# Altium schematic sheet 08_RJ45.SchDoc
size 322 x 137 mm; DsnPath: C:\Users\nilot\Documents\VSCode\SBC\imports\SG2002_QFN88_38_20230301_4L_V1.3_16.2.DSN; SchematicName: CV181xC_QFN88_38_DemoBoard; PageName: 08_RJ45; PageSize: Custom; TopSchematic: True
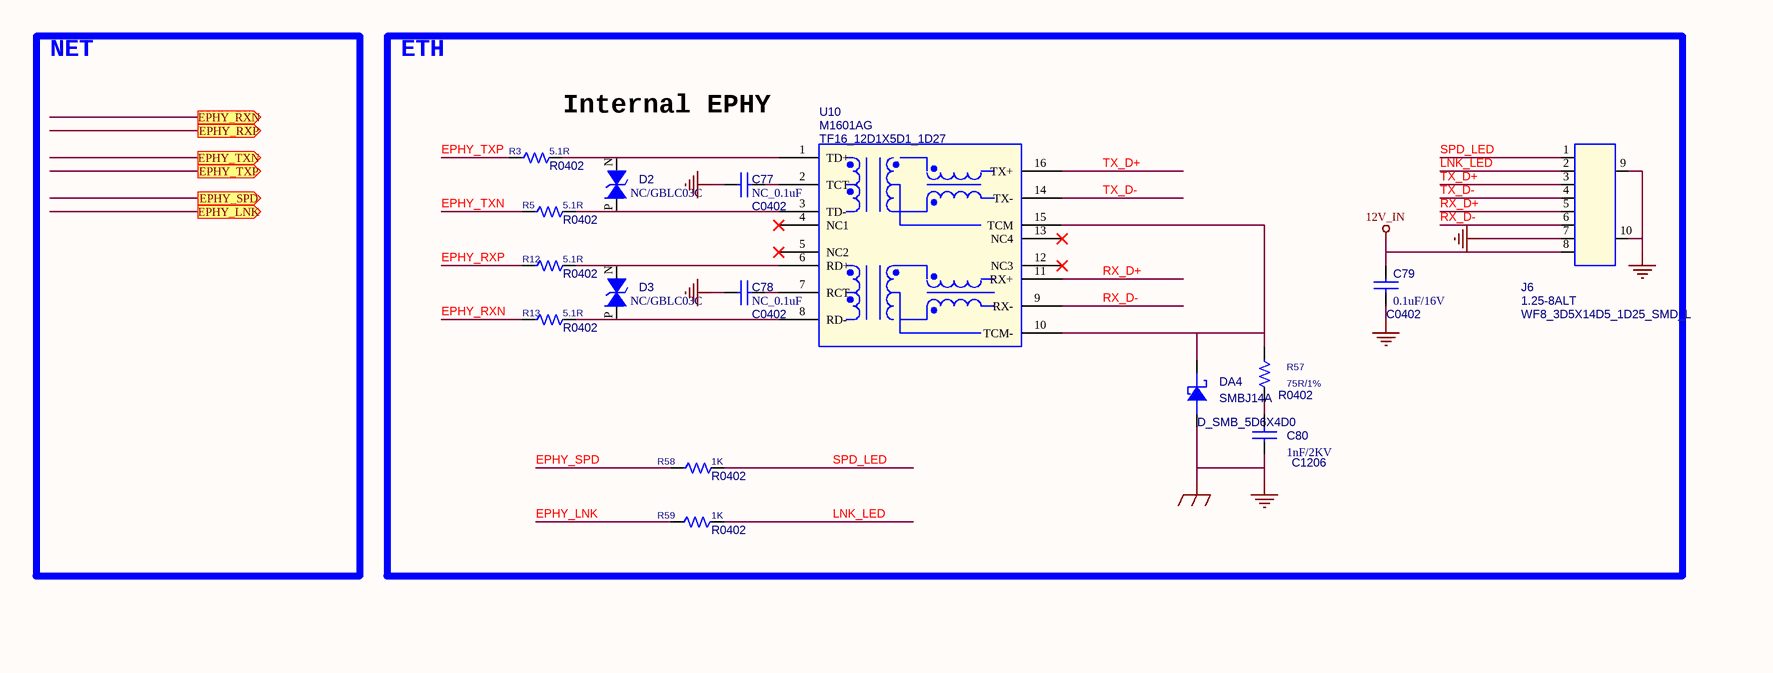
[diagram p0: 08_RJ45.SchDoc, top left]
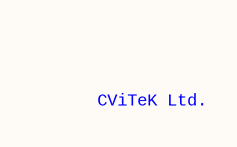
[diagram p1: 08_RJ45.SchDoc, bottom right]

## Parts
C77  NC_0.1uF  [C0402]
C78  NC_0.1uF  [C0402]
C79  0.1uF/16V  [C0402]
C80  1nF/2KV  [C1206]
D2  NC/GBLC03C  [SOD323_1D4X1D8]
D3  NC/GBLC03C  [SOD323_1D4X1D8]
DA4  SMBJ14A  [D_SMB_5D6X4D0]
J6  1.25-8ALT  [WF8_3D5X14D5_1D25_SMD_L]
R3  5.1R  [R0402]
R5  5.1R  [R0402]
R12  5.1R  [R0402]
R13  5.1R  [R0402]
R57  75R/1%  [R0402]
R58  1K  [R0402]
R59  1K  [R0402]
U10  M1601AG  [TF16_12D1X5D1_1D27]

## Ports
EPHY_LNK (out), EPHY_RXN (out), EPHY_RXP (out), EPHY_SPD (out), EPHY_TXN (out), EPHY_TXP (out)

## Nets
12V_IN: C79.1 J6.8
CHASSI_GND: C77.1 C78.1 C79.2 C80.1 DA4.P J6.7 J6.9 J6.10  [also labelled GND]
EPHY_LNK: R59.2
EPHY_RXN: R13.1
EPHY_RXP: R12.1
EPHY_SPD: R58.1
EPHY_TXN: R5.1
EPHY_TXP: R3.1
LNK_LED: J6.2 R59.1
RX_D+: J6.5 U10.11(RX+)
RX_D-: J6.6 U10.9(RX-)
SPD_LED: J6.1 R58.2
TX_D+: J6.3 U10.16(TX+)
TX_D-: J6.4 U10.14(TX-)
NetC77_2: C77.2 U10.2(TCT)
NetC78_2: C78.2 U10.7(RCT)
NetC80_2: C80.2 R57.2
NetD2_N: D2.N R3.2 U10.1(TD+)
NetD2_P: D2.P R5.2 U10.3(TD-)
NetD3_N: D3.N R12.2 U10.6(RD+)
NetD3_P: D3.P R13.2 U10.8(RD-)
NetDA4_N: DA4.N R57.1 U10.10(TCM-) U10.15(TCM)

Not connected (* = marked no-connect by the designer): U10 4(NC1)* 5(NC2)* 12(NC3)* 13(NC4)*

## Notes on the sheet
- NET
- ETH
- Internal EPHY
- CViTeK Ltd.

## Library data of the parts
C77 = C: ÌùÆ¬µçÈÝ CAP CER 0.1UF 16V 10% X7R 0402; Part Name: sC0402; Part Reference: C77; Cloud IC Number: Y02110431K00; Vendor: murata; Value: NC_0.1uF; PCB Footprint: C0402
C78 = C: ÌùÆ¬µçÈÝ CAP CER 0.1UF 16V 10% X7R 0402; Part Name: sC0402; Part Reference: C78; Cloud IC Number: Y02110431K00; Vendor: murata; Value: NC_0.1uF; PCB Footprint: C0402
C79 = C: C0402; Part Number: GRM155R61E104KA87D; Part Reference: C79; Cloud IC Number: Y02110431K00; Vendor: murata; Part Name: C0402; Value: 0.1uF/16V; PCB Footprint: C0402
C80 = C: C1206; Part Number: GRM155R61E104KA87D; Part Reference: C80; Cloud IC Number: Y02110431K00; Vendor: murata; Part Name: C1206; Value: 1nF/2KV; PCB Footprint: C1206
D2 = D_0: Part Number: 025-0402ML2R5-000; Part Reference: D2; Price: 0.07; Value: NC/GBLC03C; PCB Footprint: SOD323_1D4X1D8
D3 = D_0: Part Number: 025-0402ML2R5-000; Part Reference: D3; Price: 0.07; Value: NC/GBLC03C; PCB Footprint: SOD323_1D4X1D8
DA4 = DIODE SCHOTTKY_0: Part Reference: DA4; Value: SMBJ14A; PCB Footprint: D_SMB_5D6X4D0
J6 = CON6_2: Part Reference: J6; Value: 1.25-8ALT; PCB Footprint: WF8_3D5X14D5_1D25_SMD_L
R3 = R_Dup2: Part Reference: R3; Value: 5.1R; PCB Footprint: R0402
R5 = R_Dup2: Part Reference: R5; Value: 5.1R; PCB Footprint: R0402
R12 = R_Dup2: Part Reference: R12; Value: 5.1R; PCB Footprint: R0402
R13 = R_Dup2: Part Reference: R13; Value: 5.1R; PCB Footprint: R0402
R57 = R_Dup2: Part Reference: R57; Value: 75R/1%; PCB Footprint: R0402
R58 = R_Dup2: Part Reference: R58; Value: 1K; PCB Footprint: R0402
R59 = R_Dup2: Part Reference: R59; Value: 1K; PCB Footprint: R0402
U10 = M1601AG: Part Reference: U10; Value: M1601AG; PCB Footprint: TF16_12D1X5D1_1D27